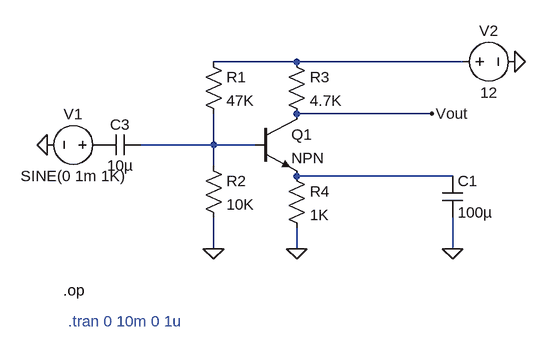
[diagram p0: schematic BJT_common-emitter_amplifier.asc]
BJT_common-emitter_amplifier.asc, the LTspice schematic file:
Version 4.1
SHEET 1 880 680
WIRE 272 64 144 64
WIRE 528 64 272 64
WIRE 480 144 272 144
WIRE 144 192 144 144
WIRE 144 192 32 192
WIRE 208 192 144 192
WIRE 144 224 144 192
WIRE 512 240 272 240
WIRE 144 352 144 304
WIRE 272 352 272 320
WIRE 512 352 512 304
FLAG 512 352 0
FLAG 144 352 0
FLAG -112 192 0
FLAG 608 64 0
FLAG 480 144 Vout
FLAG 272 352 0
SYMBOL res 128 48 R0
SYMATTR InstName R1
SYMATTR Value 47K
SYMBOL res 128 208 R0
SYMATTR InstName R2
SYMATTR Value 10K
SYMBOL res 256 48 R0
SYMATTR InstName R3
SYMATTR Value 4.7K
SYMBOL res 256 224 R0
SYMATTR InstName R4
SYMATTR Value 1K
SYMBOL cap 496 240 R0
SYMATTR InstName C1
SYMATTR Value 100µ
SYMBOL cap 32 176 R90
WINDOW 0 0 32 VBottom 2
WINDOW 3 32 32 VTop 2
SYMATTR InstName C3
SYMATTR Value 10µ
SYMBOL voltage -16 192 R90
WINDOW 0 -32 56 VBottom 2
WINDOW 3 32 56 VTop 2
WINDOW 123 0 0 Left 0
WINDOW 39 0 0 Left 0
SYMATTR InstName V1
SYMATTR Value SINE(0 1m 1K)
SYMBOL npn 208 144 R0
SYMATTR InstName Q1
SYMBOL voltage 512 64 R270
WINDOW 0 32 56 VTop 2
WINDOW 3 -32 56 VBottom 2
WINDOW 123 0 0 Left 0
WINDOW 39 0 0 Left 0
SYMATTR InstName V2
SYMATTR Value 12
TEXT -88 416 Left 2 !.op
TEXT -80 464 Left 2 ;.tran 0 10m 0 1u

The netlist it stands for:
* BJT_common-emitter_amplifier.asc
R1 N001 N002 47K
R2 N002 0 10K
R3 N001 Vout 4.7K
R4 N003 0 1K
C1 N003 0 100µ
C3 N002 P001 10µ
V1 P001 0 SINE(0 1m 1K)
Q1 Vout N002 N003 0 NPN
V2 N001 0 12
.model NPN NPN
.model PNP PNP
.lib standard.bjt
.op
* .tran 0 10m 0 1u
.backanno
.end